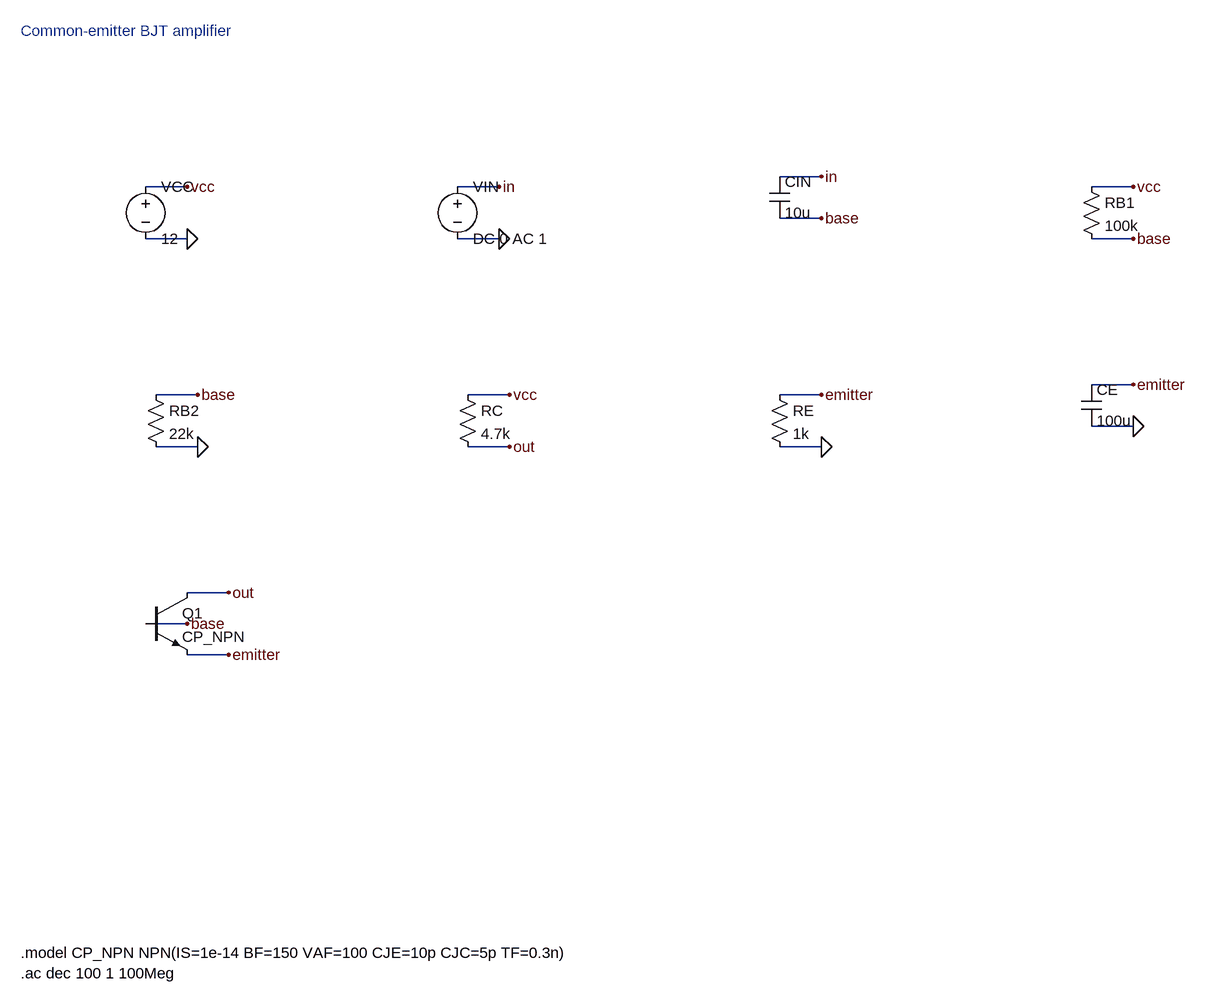
[diagram p0: schematic common-emitter-bjt-amplifier.asc]
common-emitter-bjt-amplifier.asc, the LTspice schematic file:
Version 4
SHEET 1 2400 2000
TEXT 64 32 Left 2 ;Common-emitter BJT amplifier
SYMBOL voltage 256 256 R0
SYMATTR InstName VCC
SYMATTR Value 12
WIRE 320 272 256 272
FLAG 320 272 vcc
WIRE 320 352 256 352
FLAG 320 352 0
SYMBOL voltage 736 256 R0
SYMATTR InstName VIN
SYMATTR Value DC 0 AC 1
WIRE 800 272 736 272
FLAG 800 272 in
WIRE 800 352 736 352
FLAG 800 352 0
SYMBOL cap 1216 256 R0
SYMATTR InstName CIN
SYMATTR Value 10u
WIRE 1296 256 1232 256
FLAG 1296 256 in
WIRE 1296 320 1232 320
FLAG 1296 320 base
SYMBOL res 1696 256 R0
SYMATTR InstName RB1
SYMATTR Value 100k
WIRE 1776 272 1712 272
FLAG 1776 272 vcc
WIRE 1776 352 1712 352
FLAG 1776 352 base
SYMBOL res 256 576 R0
SYMATTR InstName RB2
SYMATTR Value 22k
WIRE 336 592 272 592
FLAG 336 592 base
WIRE 336 672 272 672
FLAG 336 672 0
SYMBOL res 736 576 R0
SYMATTR InstName RC
SYMATTR Value 4.7k
WIRE 816 592 752 592
FLAG 816 592 vcc
WIRE 816 672 752 672
FLAG 816 672 out
SYMBOL res 1216 576 R0
SYMATTR InstName RE
SYMATTR Value 1k
WIRE 1296 592 1232 592
FLAG 1296 592 emitter
WIRE 1296 672 1232 672
FLAG 1296 672 0
SYMBOL cap 1696 576 R0
SYMATTR InstName CE
SYMATTR Value 100u
WIRE 1776 576 1712 576
FLAG 1776 576 emitter
WIRE 1776 640 1712 640
FLAG 1776 640 0
SYMBOL npn 256 896 R0
SYMATTR InstName Q1
SYMATTR Value CP_NPN
WIRE 384 896 320 896
FLAG 384 896 out
WIRE 320 944 256 944
FLAG 320 944 base
WIRE 384 992 320 992
FLAG 384 992 emitter
TEXT 64 1450 Left 2 !.model CP_NPN NPN(IS=1e-14 BF=150 VAF=100 CJE=10p CJC=5p TF=0.3n)
TEXT 64 1482 Left 2 !.ac dec 100 1 100Meg

The netlist it stands for:
* common-emitter-bjt-amplifier.asc
VCC vcc 0 12
VIN in 0 DC 0 AC 1
CIN in base 10u
RB1 vcc base 100k
RB2 base 0 22k
RC vcc out 4.7k
RE emitter 0 1k
CE emitter 0 100u
Q1 out base emitter 0 CP_NPN
.model NPN NPN
.model PNP PNP
.lib standard.bjt
* Common-emitter BJT amplifier
.model CP_NPN NPN(IS=1e-14 BF=150 VAF=100 CJE=10p CJC=5p TF=0.3n)
.ac dec 100 1 100Meg
.backanno
.end